# EasyEDA Pro project ProPrj_步进电机驱动功能板_2026-11-11.epro

# Schematic Schematic1
Assembly Variant: Basic; Board Name: Board1; Create Date: 2026-11-10; Page Name: P1; Project Name: 步进电机驱动功能板; Schematic Name: Schematic1; Update Date: 2026-11-10; Company: 嘉立创EDA; Page Size: A4; Version: V1.0
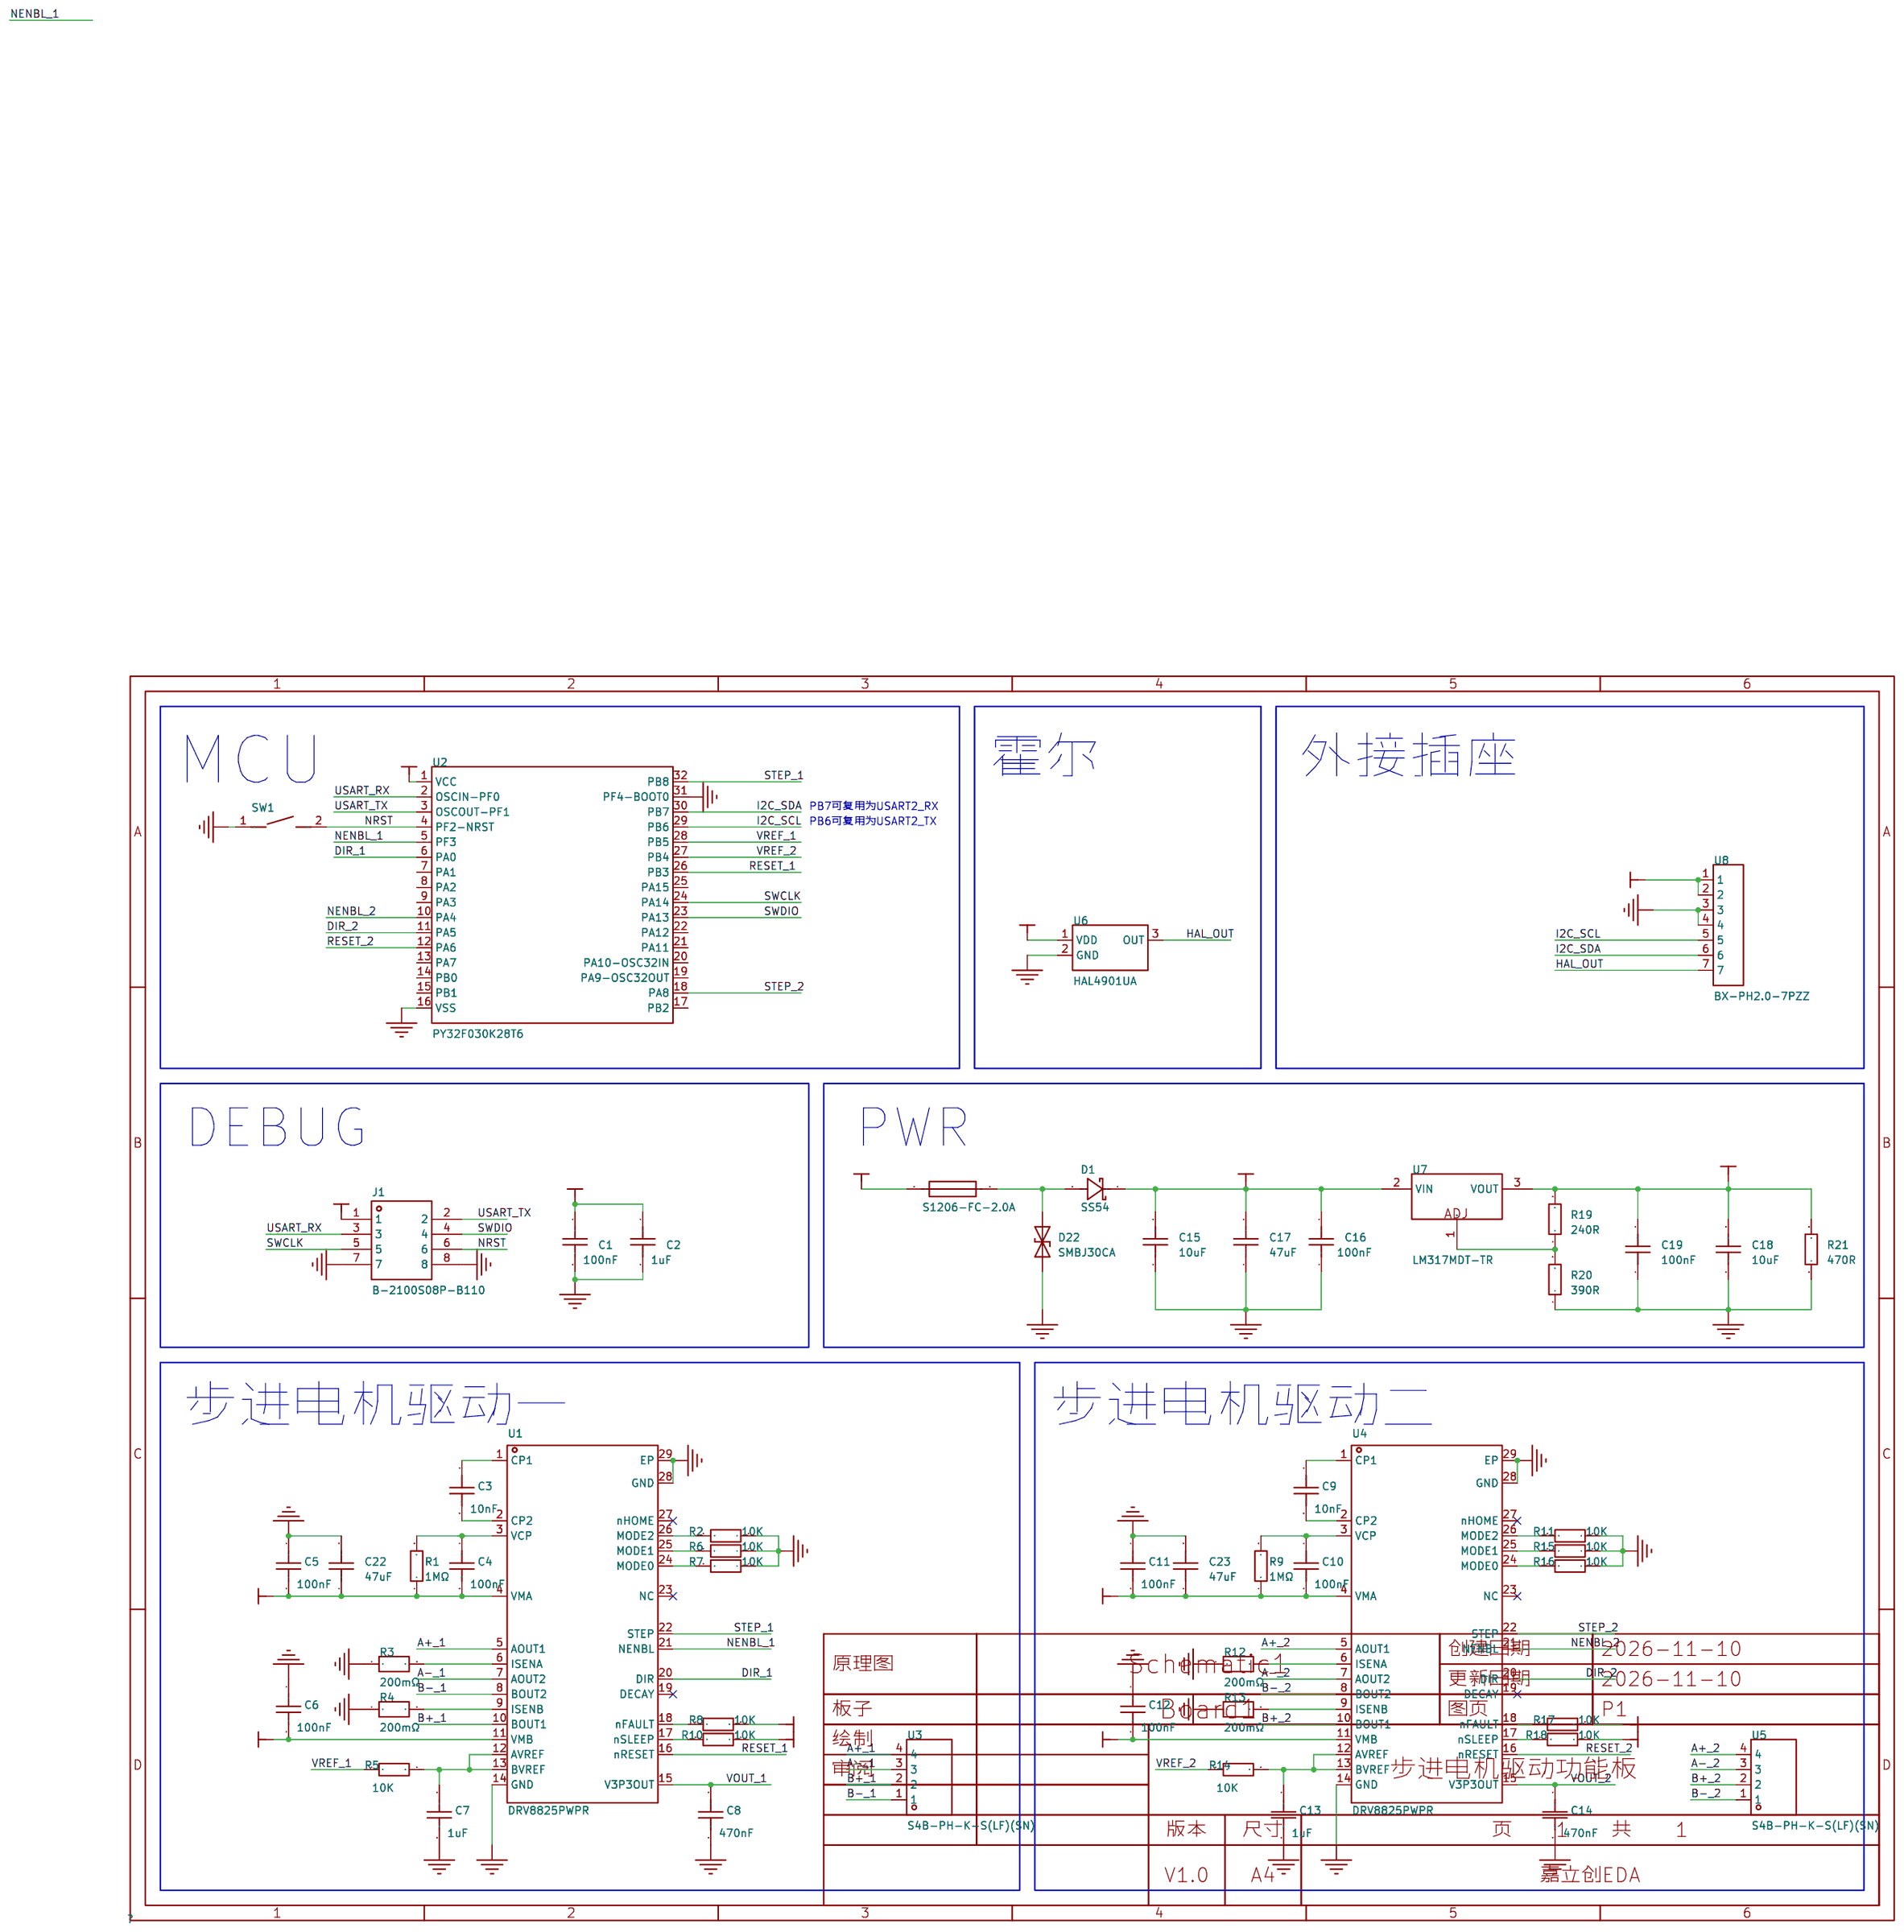
[diagram p0: schematic sheet]

## Parts
C1  100nF  [C0603]
C2  1uF  [C0603]
C3  10nF  [C0603]
C4  100nF  [C0603]
C5  100nF  [C0603]
C6  100nF  [C0603]
C7  1uF  [C0603]
C8  470nF  [C0603]
C9  10nF  [C0603]
C10  100nF  [C0603]
C11  100nF  [C0603]
C12  100nF  [C0603]
C13  1uF  [C0603]
C14  470nF  [C0603]
C15  10uF  [C0805]
C16  100nF  [C0603]
C17  47uF  [C0805]
C18  10uF  [C0805]
C19  100nF  [C0603]
C22  47uF  [C0805]
C23  47uF  [C0805]
D1  SS54  [SMA_L4.3-W2.6-LS5.0-RD]
D22  SMBJ30CA  [SMB_L4.3-W3.6-LS5.4-BI]
F2  S1206-FC-2.0A  [F1206]
J1  B-2100S08P-B110  [HDR-TH_8P-P2.54-V-M-R2-C4-S2.54]
R1  1MΩ  [R0603]
R2  10K  [R0603]
R3  200mΩ  [R2512]
R4  200mΩ  [R2512]
R5  10K  [R0603]
R6  10K  [R0603]
R7  10K  [R0603]
R8  10K  [R0603]
R9  1MΩ  [R0603]
R10  10K  [R0603]
R11  10K  [R0603]
R12  200mΩ  [R2512]
R13  200mΩ  [R2512]
R14  10K  [R0603]
R15  10K  [R0603]
R16  10K  [R0603]
R17  10K  [R0603]
R18  10K  [R0603]
R19  240R  [R0603]
R20  390R  [R0603]
R21  470R  [R0603]
SW1  TS-1088-AR02016  [SW-SMD_L3.9-W3.0-P4.45]
U1  DRV8825PWPR  [HTSSOP-28_L9.7-W4.4-P0.65-LS6.4-BL-EP]
U2  PY32F030K28T6  [LQFP-32_L7.0-W7.0-P0.80-LS9.0-BL]
U3  S4B-PH-K-S(LF)(SN)  [CONN-TH_4P-P2.00_S4B-PH-K-S-LF-SN]
U4  DRV8825PWPR  [HTSSOP-28_L9.7-W4.4-P0.65-LS6.4-BL-EP]
U5  S4B-PH-K-S(LF)(SN)  [CONN-TH_4P-P2.00_S4B-PH-K-S-LF-SN]
U6  HAL4901UA  [HDR-TH_3P-P2.54-V-M]
U7  LM317MDT-TR  [TO-252-2_L6.6-W6.1-P4.57-LS9.9-TL]
U8  BX-PH2.0-7PZZ  [CONN-TH_7P-P2.00_BX-PH2.0-7PZZ]

## Library data of the parts
C1 C2 = CC0603KRX7R9BB104: 容值:100nF;精度:±10%;额定电压:50V;温度系数:X7R;; LCSC Part Name: 100nF ±10% 50V; Supplier Part: C14663; Manufacturer: YAGEO(国巨); Supplier Footprint: 0603; JLCPCB Part Class: Basic Part; Datasheet: https://item.szlcsc.com/datasheet/CC0603KRX7R9BB104/15331.html; Supplier: LCSC; Tolerance: ±10%; Voltage Rating: 50V; Temperature Coefficient: X7R
C3-C14 C16 C19 = CAP_0603: Supplier Footprint: 0603
C15 C17 C18 = CAP_0805: Supplier Footprint: 0805
C22 C23 = HGC0805R5476M100NSLJ: 容值:47uF;精度:±20%;额定电压:10V;温度系数:X5R;; LCSC Part Name: 47uF ±20% 10V; Supplier Part: C19103846; Manufacturer: Chinocera(华瓷); Supplier Footprint: 0805; JLCPCB Part Class: Extended Part; Datasheet: https://item.szlcsc.com/datasheet/HGC0805R5476M100NSLJ/20314358.html; Supplier: LCSC; Tolerance: ±20%; Voltage Rating: 10V; Temperature Coefficient: X5R
D1 = SS56_C18199169: 二极管配置:独立式;正向压降(Vf):700mV@5A;直流反向耐压(Vr):60V;整流电流:5A;; LCSC Part Name: 电压:60V 电流:5A; Supplier Part: C18199169; Manufacturer: R+O(宏嘉诚); Supplier Footprint: SMA(DO-214AC); JLCPCB Part Class: Extended Part; Datasheet: https://item.szlcsc.com/datasheet/SS56/19354401.html; Supplier: LCSC; Diode Configuration: 独立式; Voltage - Forward(Vf@If): 700mV@5A; Voltage - DC Reverse(Vr): 60V; Current - Rectified: 5A; Reverse Leakage Current (Ir): 200uA@60V; Operating Junction Temperature Range: -55℃~+125℃; Non-Repetitive Peak Forward Surge Current: 120A
D22 = SMBJ30CA_C83847: 极性:双向;反向截止电压(Vrwm):30V;钳位电压:48.4V;峰值脉冲电流(Ipp):12.4A;峰值脉冲功率(Ppp):600W@10/1000us;击穿电压(VBR):33.3V;; LCSC Part Name: 双向TVS 30V截止 峰值浪涌电流：12.4A; Supplier Part: C83847; Manufacturer: Littelfuse(美国力特); Supplier Footprint: DO-214AA; JLCPCB Part Class: Extended Part; Datasheet: https://item.szlcsc.com/datasheet/SMBJ30CA/85014.html; Supplier: LCSC; Polarity: 双向; Reverse Stand-Off Voltage (Vrwm): 30V; Clamping Voltage: 48.4V; Peak Pulse Current (Ipp): 12.4A; Peak Pulse Power Dissipation (Ppp): 600W@10/1000us; Voltage - Breakdown: 33.3V; Reverse Leakage Current (Ir): 1uA; Number of Channels: 单路; Operating Temperature: -65℃~+150℃; level of protection: IEC 61000-4-4；IEC 61000-4-2; Type: TVS
F2 = S1206-FC-2.0A: 类型:贴片式保险丝;额定电流:2A;额定电压:100V;分断能力:50A@100VDC;; LCSC Part Name: 保险丝 2A 100V; Supplier Part: C2691995; Manufacturer: SART(萨特); Supplier Footprint: 1206; JLCPCB Part Class: Extended Part; Datasheet: https://item.szlcsc.com/datasheet/S1206-FC-2.0A/2802628.html; Supplier: LCSC; Type: 贴片式保险丝; Current Rating: 2A; Voltage Rating (DC): 100V; Operating Temperature: -55℃~+125℃; Melting I2t: 0.1; Interrupt Rating: 50A@100VDC; Length: 3.2mm; Width: 1.6mm; Height: 0.8mm
J1 = B-2100S08P-B110: 插针结构:2x4P;间距:2.54mm;行距:2.54mm;圆针/方针:方针;安装方式:直插;排数:双排;总PIN位数:8P;额定电流:3A;额定电压:-;配合针长度:6mm;塑高:2.54mm;端接针长度:3mm;触头材质:黄铜;触头镀层:金;工作温度:-40℃~+105℃;颜色:黑色;; LCSC Part Name: 2x4P 间距:2.54mm 方针 直插; Supplier Part: C124386; Manufacturer: Ckmtw(灿科盟); Supplier Footprint: 插件,P=2.54mm; JLCPCB Part Class: Extended Part; Datasheet: https://item.szlcsc.com/datasheet/B-2100S08P-B110/125661.html; Supplier: LCSC; Pin Structure: 2x4P; Pitch: 2.54mm; Row Spacing: 2.54mm; Circluar Pins/Square Pins: 方针; Mounting Type: 直插; Number of Rows: 双排; Number of Pins: 8P; Current Rating: 3A; Length of Mating Pin: 6mm; Insulation Height: 2.54mm; Length of End Connection Pin: 3mm; Contact Material: 黄铜; Contact Plating: 金; Operating Temperature: -40℃~+105℃; Color: 黑色
R1 R2 R5-R11 R14-R21 = Res_0603: Supplier Footprint: 0603
R3 R4 R12 R13 = FRM252WJR200TK: 电阻类型:采样电阻;阻值:200mΩ;精度:±5%;功率:2W;温度系数:±50ppm/℃;; LCSC Part Name: 200mΩ ±5% 2W 合金电阻; Supplier Part: C7420022; Manufacturer: FOJAN(富捷); Supplier Footprint: 2512; JLCPCB Part Class: Extended Part; Datasheet: https://item.szlcsc.com/datasheet/FRM252WJR200TK/8395315.html; Supplier: LCSC; Type: 采样电阻; Tolerance: ±5%; Power(Watts): 2W; Temperature Coefficient: ±50ppm/℃
SW1 = TS-1088-AR02016: 电路结构:单刀单掷;按钮形状:圆形按钮;作用力:1.6N;安装方式:立贴;开关长度:3.9mm;开关宽度:3mm;开关高度:2mm;带支架:不带支架;触点电流:50mA;额定电压:12V;带灯:-;工作寿命:10万次;; LCSC Part Name: 3.9*3*2mm 立贴 轻触开关; Supplier Part: C720477; Manufacturer: XUNPU(讯普); Supplier Footprint: SMD,4x3mm; JLCPCB Part Class: Basic Part; Datasheet: https://item.szlcsc.com/datasheet/TS-1088-AR02016/763484.html; Supplier: LCSC; Circuit: 单刀单掷; Actuator Style: 圆形按钮; Operating Force: 1.6N; Mounting Type: 立贴; Length: 3.9mm; Width: 3mm; Switch Height: 2mm; with Bracket: 不带支架; Contact Current: 50mA; Voltage Rating: 12V; Actuator/Cap Color: 黑色; Termination Style: SMD接片; Life: 10万次; Operating Temperature: -30℃~+80℃; Check: true
U1 U4 = DRV8825PWPR: DRV8825 具有电流调节功能和 1/32 微步进的 45V、2.5A 双极步进电机驱动器; LCSC Part Name: 2.5A 45V电机驱动芯片; Supplier Part: C81582; Manufacturer: TI(德州仪器); Supplier Footprint: HTSSOP-28-EP; JLCPCB Part Class: Extended Part; Datasheet: https://www.ti.com/cn/lit/ds/symlink/drv8825.pdf; Supplier: LCSC; Motor Drive Voltage(Vm): 8.2V~45V; Output Current: 2.5A; Number of H-bridges: 2; Drive Type: 双极驱动; Step Resolution: 32; Interface: STEP/DIR; Technology: 是; RDS(on): 200mΩ; Operating Temperature: -40℃~+85℃; Features: 过流保护；防止电机失步功能；过温保护；欠压锁定
U2 = PY32F030K28T6: 应用领域:-;; LCSC Part Name: PY32F030K28T6 30IO; Supplier Part: C3018720; Manufacturer: PUYA(普冉); Supplier Footprint: LQFP-32(7x7); JLCPCB Part Class: Extended Part; Datasheet: https://item.szlcsc.com/datasheet/PY32F030K28T6/3531934.html; Supplier: LCSC; Program Storage Size: 64KB; Program Memory Type: FLASH; Check: true
U3 U5 = S4B-PH-K-S(LF)(SN): 插针结构:1x4P;间距:2mm;安装方式:弯插;参考系列:PH;总PIN数:4P;排数:1;每排PIN数:4;行距:-;额定电流:2A;触头材质:黄铜;触头镀层:锡;工作温度:-25℃~+85℃;; LCSC Part Name: 1x4P 间距:2mm 弯插 系列:PH; Supplier Part: C157926; Manufacturer: JST; Supplier Footprint: 弯插,P=2mm; JLCPCB Part Class: Extended Part; Datasheet: https://item.szlcsc.com/datasheet/S4B-PH-K-S(LF)(SN)/169274.html; Supplier: LCSC; Pins Structure: 1x4P; Pitch: 2mm; Mounting Type: 弯插; Reference Series: PH; Number of Pins: 4P; Number of Rows: 1; Number of PINs Per Row: 4; Current Rating: 2A; Contact Material: 黄铜; Contact Plating: 锡; Operating Temperature: -25℃~+85℃; Voltage Rating: 100V; Plastic Material: PA66; Flame Retardant Rating: UL94V-0; Supplementary Features: 打K脚; Color: 白色; Z-Height of the Board: 4.8mm; X-Length of Bottom Edge on Board (Spacing Line): 9.9mm; Y-Width of Bottom Edge on Board: 7.6mm
U6 = HAL4901UA: 超高灵敏度线性霍尔元件，智能围棋霍尔IC; LCSC Part Name: 超高灵敏度线性霍尔元件,智能围棋霍尔IC; Supplier Part: C7420987; Manufacturer: Hallwee(霍尔微电子); Supplier Footprint: TO-92S; JLCPCB Part Class: Extended Part; Datasheet: https://item.szlcsc.com/datasheet/HAL4901UA/8400266.html; Supplier: LCSC; Magnetic Field Range: ±10mT; Sensitivity: 15mV/Gs; Sensitivity Temperature Bleaching: ±10%/℃; Linearity: ±1.5%; Voltage - Supply: 2.5V~6.5V; Supply Current: 1.9mA; Operating Temperature: -40℃~+150℃
U7 = LM317MDT-TR: 输出极性:正极;工作电压:40V;输出电压:1.2V~37V;输出电流:500mA;电源纹波抑制比(PSRR):80dB@(120Hz);输出类型:可调;; LCSC Part Name: 1.2V~37V 500mA 40V; Supplier Part: C68136; Manufacturer: ST(意法半导体); Supplier Footprint: TO-252-2(DPAK); JLCPCB Part Class: Extended Part; Datasheet: https://item.szlcsc.com/datasheet/LM317MDT-TR/69238.html; Supplier: LCSC; Output Configuration: 正极; Voltage - Supply: 40V; Output Voltage: 1.2V~37V; Output Current: 500mA; Power Supply Rejection Ratio (PSRR): 80dB@(120Hz); Noise: 0.003%Vout; Features: 短路保护；热关断; Operating Temperature: 0℃~+125℃@(Tj); Output Type: 可调; Number of Outputs: 1
U8 = BX-PH2.0-7PZZ: 插针结构:1x7P;间距:2mm;安装方式:直插;参考系列:PH;总PIN数:7P;排数:1;每排PIN数:7;行距:-;额定电流:2A;触头材质:黄铜;触头镀层:锡;工作温度:-25℃~+85℃;; LCSC Part Name: 1x7P 间距:2mm 直插 系列:PH; Supplier Part: C18077749; Manufacturer: Bossie(博锡); Supplier Footprint: 插件,P=2mm; JLCPCB Part Class: Extended Part; Datasheet: https://item.szlcsc.com/datasheet/BX-PH2.0-7PZZ/19218150.html; Supplier: LCSC; Pins Structure: 1x7P; Pitch: 2mm; Mounting Type: 直插; Reference Series: PH; Number of Pins: 7P; Number of Rows: 1; Number of PINs Per Row: 7; Current Rating: 2A; Contact Material: 黄铜; Contact Plating: 锡; Operating Temperature: -25℃~+85℃; Voltage Rating: 250V; Plastic Material: PA66; Flame Retardant Rating: UL94V-0; Color: 白色; Z-Height of the Board: 6.05mm; X-Length of Bottom Edge on Board (Spacing Line): 16mm; Y-Width of Bottom Edge on Board: 4.7mm

## Nets
3V3: C1.1 C2.1 C18.2 C19.2 J1.1 R8.2 R10.1 R17.2 R18.1 R19.2 R21.2 U2.1(VCC) U6.1(VDD) U7.3(VOUT)
+24V: C4.2 C5.2 C6.2 C10.2 C11.2 C12.2 C15.2 C16.2 C17.2 C22.1 C23.1 D1.1(K) R1.1 R9.1 U1.4(VMA) U1.11(VMB) U4.4(VMA) U4.11(VMB) U7.2(VIN)
GND: C1.2 C2.2 C5.1 C6.1 C7.2 C8.2 C11.1 C12.1 C13.2 C14.2 C15.1 C16.1 C17.1 C18.1 C19.1 C22.2 C23.2 D22.2(A1) J1.7 J1.8 R2.1 R3.1 R4.1 R6.1 R7.1 R11.1 R12.1 R13.1 R15.1 R16.1 R20.1 R21.1 SW1.1 U1.14(GND) U1.28(GND) U1.29(EP) U2.16(VSS) U2.31(PF4-BOOT0) U4.14(GND) U4.28(GND) U4.29(EP) U6.2(GND) U8.3 U8.4
A+_1: U1.5(AOUT1) U3.4
A+_2: U4.5(AOUT1) U5.4
A-_1: U1.7(AOUT2) U3.3
A-_2: U4.7(AOUT2) U5.3
B+_1: U1.10(BOUT1) U3.2
B+_2: U4.10(BOUT1) U5.2
B-_1: U1.8(BOUT2) U3.1
B-_2: U4.8(BOUT2) U5.1
DIR_1: U1.20(DIR) U2.6(PA0)
DIR_2: U2.11(PA5) U4.20(DIR)
HAL_OUT: U6.3(OUT) U8.7
I2C_SCL: U2.29(PB6) U8.5
I2C_SDA: U2.30(PB7) U8.6
NENBL_1: U1.21(NENBL) U2.5(PF3)
NENBL_2: U2.10(PA4) U4.21(NENBL)
NRST: J1.6 SW1.2 U2.4(PF2-NRST)
RESET_1: U1.16(nRESET) U2.26(PB3)
RESET_2: U2.12(PA6) U4.16(nRESET)
STEP_1: U1.22(STEP) U2.32(PB8)
STEP_2: U2.18(PA8) U4.22(STEP)
SWCLK: J1.5 U2.24(PA14)
SWDIO: J1.4 U2.23(PA13)
USART_RX: J1.3 U2.2(OSCIN-PF0)
USART_TX: J1.2 U2.3(OSCOUT-PF1)
VCOM: F2.1 U8.1 U8.2
VOUT_1: C8.1 U1.15(V3P3OUT)
VOUT_2: C14.1 U4.15(V3P3OUT)
VREF_1: R5.1 U2.28(PB5)
VREF_2: R14.1 U2.27(PB4)
$1N37: C3.1 U1.1(CP1)
$1N38: C3.2 U1.2(CP2)
$1N39: C4.1 R1.2 U1.3(VCP)
$1N53: R4.2 U1.9(ISENB)
$1N56: R3.2 U1.6(ISENA)
$1N57: C7.1 R5.2 U1.12(AVREF) U1.13(BVREF)
$1N72: R10.2 U1.17(nSLEEP)
$1N80: R8.1 U1.18(nFAULT)
$1N83: R2.2 U1.26(MODE2)
$1N84: R6.2 U1.25(MODE1)
$1N85: R7.2 U1.24(MODE0)
$1N96: R11.2 U4.26(MODE2)
$1N97: R15.2 U4.25(MODE1)
$1N98: R16.2 U4.24(MODE0)
$1N100: R17.1 U4.18(nFAULT)
$1N107: C13.1 R14.2 U4.12(AVREF) U4.13(BVREF)
$1N108: R12.2 U4.6(ISENA)
$1N109: R13.2 U4.9(ISENB)
$1N112: R18.2 U4.17(nSLEEP)
$1N121: C10.1 R9.2 U4.3(VCP)
$1N122: C9.2 U4.2(CP2)
$1N123: C9.1 U4.1(CP1)
$1N134: D1.2(A) D22.1(A2) F2.2
$1N139: R19.1 R20.2 U7.1(ADJ)

Not connected (* = marked no-connect by the designer): U1 19(DECAY)* 23(NC)* 27(nHOME)*; U2 7(PA1) 8(PA2) 9(PA3) 13(PA7) 14(PB0) 15(PB1) 17(PB2) 19(PA9-OSC32OUT) 20(PA10-OSC32IN) 21(PA11) 22(PA12) 25(PA15); U4 19(DECAY)* 23(NC)* 27(nHOME)*

## Notes on the sheet
- MCU
- 霍尔
- 外接插座
- PB7可复用为USART2_RX
- PB6可复用为USART2_TX
- DEBUG
- PWR
- 步进电机驱动一
- 步进电机驱动二

# Board PCB1
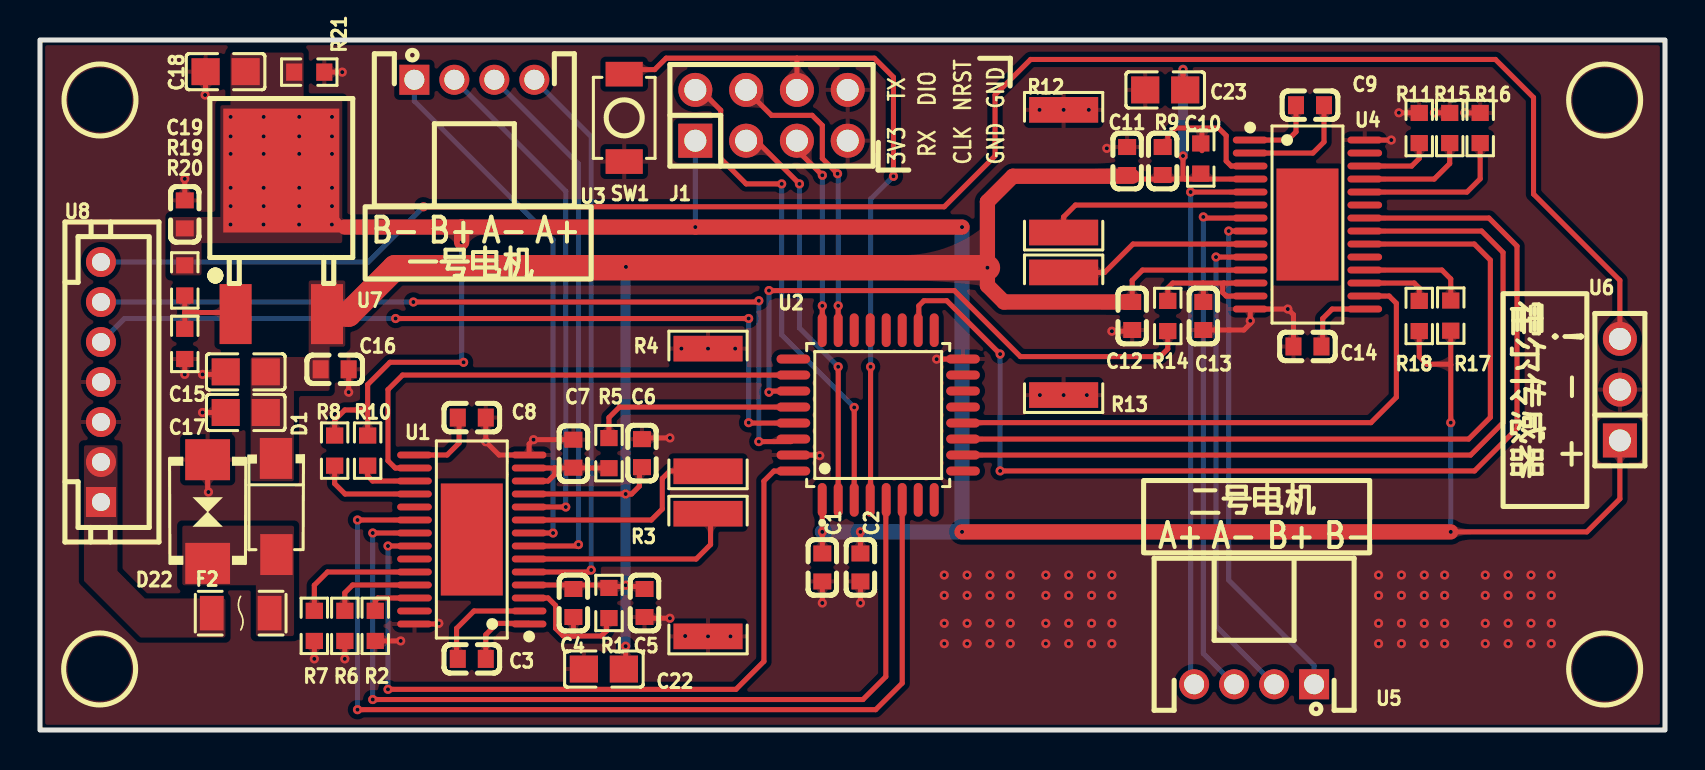
[diagram p1: board, top side]
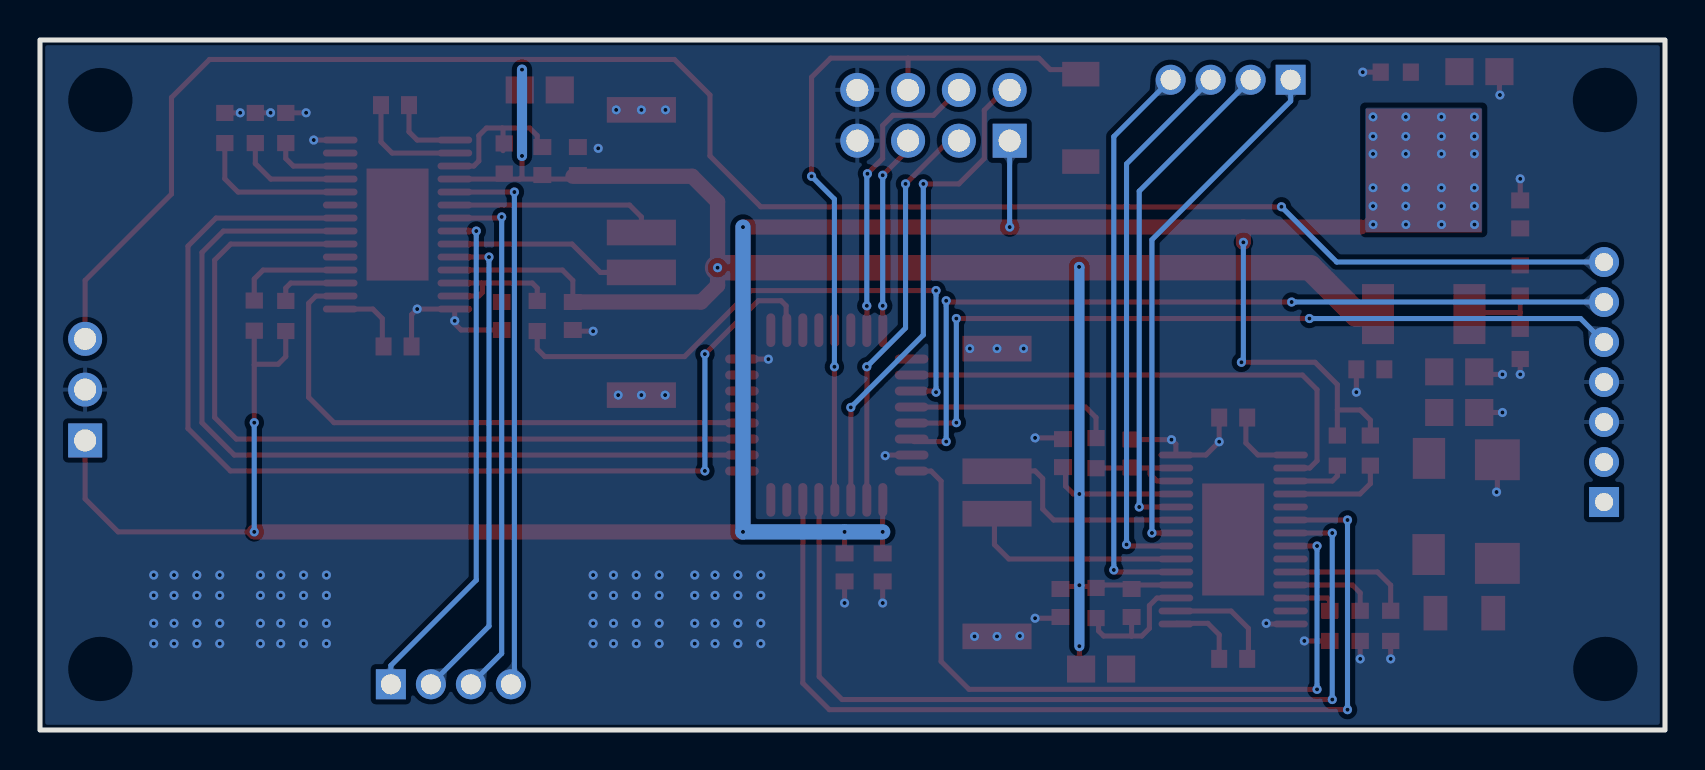
[diagram p2: board, bottom side, seen from below]

Outline 81.25 x 34.5 mm; copper layers: Top Layer, Bottom Layer. Coordinates in mm from the lower left corner of the outline.
Outline path: rectangle 0,34.5 81.25,0
Stack: Top Layer 0.035mm / Dielectric1 1.51mm FR4 er 4.5 / Bottom Layer 0.035mm

## Design rules (mm)
spacing copperThickness1oz (default): track to track 0.102, other pairs 0.102 to 0.3
spacing copperThickness2oz: track to track 0.203, other pairs 0.152 to 0.3
track width copperThickness1oz (default): min 0.127, default 0.254, max 2.54
track width copperThickness2oz: min 0.203, default 0.254, max 2.54
differential pair differentialPair (default): width min 0.127, default 0.254, max 2.54; gap min 0.152, default 0.152
net GND uses copperRegion
net +24V uses copperRegion
net 3V3 uses copperRegion
net $1N134 uses PWR_copperThickness1oz
net VCOM uses copperRegion
pour e3841 uses PWR_default, default
pour e3845 uses PWR_copperThickness1oz

## Placement (name value [footprint] x y rotation side)
C1  100nF  [C0603]  39.12 8.13 270 top
C2  1uF  [C0603]  41.02 8.13 270 top
C3  10nF  [C0603]  21.59 3.56 180 top
C4  100nF  [C0603]  26.67 6.35 90 top
C5  100nF  [C0603]  30.23 6.35 90 top
C6  100nF  [C0603]  30.1 13.84 270 top
C7  1uF  [C0603]  26.67 13.82 90 top
C8  470nF  [C0603]  21.59 15.62 0 top
C9  10nF  [C0603]  63.5 31.24 0 top
C10  100nF  [C0603]  56.13 28.45 270 top
C11  100nF  [C0603]  54.36 28.45 270 top
C12  100nF  [C0603]  54.61 20.7 90 top
C13  1uF  [C0603]  58.17 20.7 270 top
C14  470nF  [C0603]  63.37 19.18 180 top
C15  10uF  [C0805]  10.29 17.91 0 top
C16  100nF  [C0603]  14.73 18.03 180 top
C17  47uF  [C0805]  10.29 15.88 0 top
C18  10uF  [C0805]  9.28 32.92 0 top
C19  100nF  [C0603]  7.24 25.78 270 top
C22  47uF  [C0805]  28.19 3.05 180 top
C23  47uF  [C0805]  56.26 32 180 top
D1  SS54  [SMA_L4.3-W2.6-LS5.0-RD]  11.81 11.18 270 top
D22  SMBJ30CA  [SMB_L4.3-W3.6-LS5.4-BI]  8.38 10.92 90 top
F2  S1206-FC-2.0A  [F1206]  10.03 5.84 0 top
J1  B-2100S08P-B110  [HDR-TH_8P-P2.54-V-M-R2-C4-S2.54]  36.58 30.73 0 top
R1  1MΩ  [R0603]  28.45 6.35 270 top
R2  10K  [R0603]  16.76 5.21 90 top
R3  200mΩ  [R2512]  33.4 7.75 90 top
R4  200mΩ  [R2512]  33.4 16 270 top
R5  10K  [R0603]  28.45 13.84 270 top
R6  10K  [R0603]  15.24 5.21 90 top
R7  10K  [R0603]  13.72 5.21 90 top
R8  10K  [R0603]  14.73 13.97 90 top
R9  1MΩ  [R0603]  58.04 28.58 90 top
R10  10K  [R0603]  16.38 13.97 270 top
R11  10K  [R0603]  68.96 30.1 270 top
R12  200mΩ  [R2512]  51.18 27.94 270 top
R13  200mΩ  [R2512]  51.18 19.81 90 top
R14  10K  [R0603]  56.39 20.7 90 top
R15  10K  [R0603]  70.49 30.1 270 top
R16  10K  [R0603]  72.01 30.1 270 top
R17  10K  [R0603]  70.54 20.72 270 top
R18  10K  [R0603]  68.96 20.7 90 top
R19  240R  [R0603]  7.24 22.48 90 top
R20  390R  [R0603]  7.24 19.3 90 top
R21  470R  [R0603]  13.46 32.89 180 top
SW1  TS-1088-AR02016  [SW-SMD_L3.9-W3.0-P4.45]  29.21 30.61 90 top
U1  DRV8825PWPR  [HTSSOP-28_L9.7-W4.4-P0.65-LS6.4-BL-EP]  21.59 9.53 90 top
U2  PY32F030K28T6  [LQFP-32_L7.0-W7.0-P0.80-LS9.0-BL]  41.91 15.75 0 top
U3  S4B-PH-K-S(LF)(SN)  [CONN-TH_4P-P2.00_S4B-PH-K-S-LF-SN]  21.72 32.51 0 top
U4  DRV8825PWPR  [HTSSOP-28_L9.7-W4.4-P0.65-LS6.4-BL-EP]  63.37 25.27 270 top
U5  S4B-PH-K-S(LF)(SN)  [CONN-TH_4P-P2.00_S4B-PH-K-S-LF-SN]  60.71 2.29 180 top
U6  HAL4901UA  [HDR-TH_3P-P2.54-V-M]  78.99 17.02 90 top
U7  LM317MDT-TR  [TO-252-2_L6.6-W6.1-P4.57-LS9.9-TL]  12.06 24.38 90 top
U8  BX-PH2.0-7PZZ  [CONN-TH_7P-P2.00_BX-PH2.0-7PZZ]  3.05 17.4 90 top

## Footprints (pads in the part's own frame, mm; a bottom-side part is the same pattern mirrored in y, then rotated)
C0603
  rect 0.8x0.9 smd: 1(-0.7,0) 2(0.7,0)
C0805
  rect 1.41x1.35 smd: 1(-1,0) 2(1,0)
CONN-TH_4P-P2.00_S4B-PH-K-S-LF-SN
  rect 1.5x1.5 hole 1: 1(-3,0)
  round 1.5 hole 1: 2(-1,0) 3(1,0) 4(3,0)
CONN-TH_7P-P2.00_BX-PH2.0-7PZZ
  rect 1.5x1.5 hole 0.9: 1(-6,0)
  round 1.5 hole 0.9: 2(-4,0) 3(-2,0) 4(0,0) 5(2,0) 6(4,0) 7(6,0)
F1206
  rect 1.19x1.728 smd: 1(-1.445,0) 2(1.445,0)
HDR-TH_3P-P2.54-V-M
  rect 1.7x1.7 hole 1.1: 1(-2.54,0)
  round 1.7 hole 1.1: 2(0,0) 3(2.54,0)
HDR-TH_8P-P2.54-V-M-R2-C4-S2.54
  rect 1.7x1.7 hole 1.1: 1(-3.81,-1.27)
  round 1.7 hole 1.1: 2(-3.81,1.27) 3(-1.27,-1.27) 4(-1.27,1.27) 5(1.27,-1.27) 6(1.27,1.27) 7(3.81,-1.27) 8(3.81,1.27)
HTSSOP-28_L9.7-W4.4-P0.65-LS6.4-BL-EP
  oval 0.343x1.732 smd: 1(-4.225,-2.866) 2(-3.575,-2.866) 3(-2.925,-2.866) 4(-2.275,-2.866) 5(-1.625,-2.866) 6(-0.975,-2.866) 7(-0.325,-2.866) 8(0.325,-2.866) 9(0.975,-2.866) 10(1.625,-2.866) 11(2.275,-2.866) 12(2.925,-2.866) 13(3.575,-2.866) 14(4.225,-2.866) 15(4.225,2.866) 16(3.575,2.866) 17(2.925,2.866) 18(2.275,2.866) 19(1.625,2.866) 20(0.975,2.866) 21(0.325,2.866) 22(-0.325,2.866) 23(-0.975,2.866) 24(-1.625,2.866) 25(-2.275,2.866) 26(-2.925,2.866) 27(-3.575,2.866) 28(-4.225,2.866)
  rect 5.6x3.1 smd: 29(0,0)
LQFP-32_L7.0-W7.0-P0.80-LS9.0-BL
  oval 0.448x1.684 smd: 1(-2.8,-4.242) 2(-2,-4.242) 3(-1.2,-4.242) 4(-0.4,-4.242) 5(0.4,-4.242) 6(1.2,-4.242) 7(2,-4.242) 8(2.8,-4.242) 17(2.8,4.242) 18(2,4.242) 19(1.2,4.242) 20(0.4,4.242) 21(-0.4,4.242) 22(-1.2,4.242) 23(-2,4.242) 24(-2.8,4.242)
  oval 1.684x0.448 smd: 9(4.242,-2.8) 10(4.242,-2) 11(4.242,-1.2) 12(4.242,-0.4) 13(4.242,0.4) 14(4.242,1.2) 15(4.242,2) 16(4.242,2.8) 25(-4.242,2.8) 26(-4.242,2) 27(-4.242,1.2) 28(-4.242,0.4) 29(-4.242,-0.4) 30(-4.242,-1.2) 31(-4.242,-2) 32(-4.242,-2.8)
R0603
  rect 0.806x0.864 smd: 1(-0.753,0) 2(0.753,0)
R2512
  rect 1.282x3.456 smd: 1(-3.067,0) 2(3.067,0)
SMA_L4.3-W2.6-LS5.0-RD
  rect 2.046x1.62 smd: 1(-2.404,-0.009) 2(2.404,0.009)
SMB_L4.3-W3.6-LS5.4-BI
  rect 2.047x2.241 smd: 1(-2.591,0) 2(2.591,0)
SW-SMD_L3.9-W3.0-P4.45
  rect 1.23x1.86 smd: 1(-2.185,0) 2(2.185,0)
TO-252-2_L6.6-W6.1-P4.57-LS9.9-TL
  rect 3x1.6 smd: 1(-3.587,2.285) 2(-3.589,-2.285)
  rect 6.2x5.8 smd: 3(3.588,0)

## Nets
As in the schematic.

Pads without a net: U1 19 23 27; U2 7 8 9 13 14 15 17 19 20 21 22 25; U4 19 23 27

## Via types
v1: diameter 0.457, hole 0.203, Top Layer to Bottom Layer, 179 vias

## Routing (per net, layer and track width the routed paths; a pad name or vN(x,y) marks a point on that pad's centre or on a via; arc(x,y) is an arc through that point)
3V3: length 132.4
  Top Layer w0.254: 16.38,16 15.24,16 14.73,15.49 R8.2 ; 16.38,16 16.38,17.27 17.5,18.39 v1(21.18,18.39) ; 16.38,16 R10.1 ; U6.1 78.99,11.56 77.34,9.91 v1(70.54,9.91) ; 70.54,18.26 70.51,18.29 69.34,18.29 68.96,18.67 R18.1 ; 70.54,18.26 v1(70.54,15.37) ; 70.54,18.26 R17.2 ; U2.1 39.12,11.5 v1(39.12,9.91) 39.12,8.95 39.24,8.83 ; U7.3 12.41,27.97 15.24,25.15 ; C2.1 v1(41.02,9.91)
  Top Layer w0.762: v1(70.54,9.91) v1(46.1,9.91) ; 15.24,25.15 21.08,25.15 ; 21.08,25.15 v1(21.08,24.38) ; 21.08,25.15 v1(32.77,25.15) v1(46.1,25.15)
  Bottom Layer w0.254: v1(70.54,15.37) v1(70.54,9.91) ; v1(32.77,25.15) 32.77,25.15 32.77,29.46 ; v1(21.18,18.39) 21.08,18.48 v1(21.08,24.38)
  Bottom Layer w0.762: v1(39.12,9.91) v1(41.02,9.91) v1(46.1,9.91) v1(46.1,25.15)
  vias: v1(9.53,30.66) v1(9.53,29.68) v1(9.53,28.81) v1(9.53,27.11) v1(9.53,26.19) v1(9.53,25.27) v1(11.18,30.66) v1(11.18,29.68) v1(11.18,28.81) v1(11.18,27.11) v1(11.18,26.19) v1(11.18,25.27) v1(12.96,30.66) v1(12.96,29.68) v1(12.96,28.81) v1(12.96,27.11) v1(12.96,26.19) v1(12.95,25.27) v1(14.6,30.66) v1(14.6,29.68) v1(14.6,28.81) v1(14.6,27.11) v1(14.6,26.19) v1(14.59,25.27)
+24V: length 105.6
  Top Layer w0.254: 57.27,27.55 60.51,27.55 ; 57.27,27.55 54.66,27.55 54.61,27.49 ; 57.27,27.55 57.15,27.66 v1(57.15,28.7) ; 60.51,23 55.13,23 54.61,22.48 C12.2 ; C23.1 57.15,32.11 v1(57.15,33.02) ; v1(29.28,4.19) 29.28,3.14 C22.1 ; 29.97,13.14 29.97,12.19 29.58,11.8 v1(29.28,11.8) U1.11 ; 28.32,7.1 28.39,7.18 29.97,7.18 ; U1.4 28.05,7.25 28.32,6.98
  Top Layer w0.762: 54.6,27.69 48.64,27.69 47.37,26.42 v1(47.37,23.11) 47.37,22.22 48.19,21.4 C12.2
  Top Layer w1.27: v1(47.37,23.11) 17.75,23.11 15.43,20.8 U7.2
  Bottom Layer w0.508: v1(29.3,23.16) 29.28,23.14 v1(29.28,11.8) v1(29.28,7.24) v1(29.28,4.19) ; v1(57.15,33.02) v1(57.15,28.7)
GND: length 39.4
  Top Layer w0.254: v1(31.5,5.59) 30.29,5.59 C5.1 ; C7.2 v1(24.68,14.52) 24.46,14.3 U1.14 22.95,13.75 v1(22.29,14.41) C8.2 ; C15.1 9.16,17.78 v1(8.13,17.78) ; C2.2 v1(41.02,6.35) ; v1(38.99,13.72) 38.96,13.75 U2.31 ; R7.1 v1(13.72,3.56) ; C1.2 v1(39.12,6.35) ; C17.1 v1(8.13,15.88) ; v1(67.94,30.86) 68.95,30.86 R11.1 ; C13.2 60.19,20 60.51,20.32 v1(60.51,20.46) 60.51,21.04 60.51,21.05 v1(62.39,21.05) 62.67,20.77 C14.2 ; v1(19.94,5.33) 19.91,5.3 U1.28 ; v1(8.42,11.9) 8.38,11.94 D22.2 ; U2.16 44.84,18.55 v1(44.83,18.54) ; R16.1 71.25,30.85 v1(71.24,30.86) ; v1(53.59,19.94) 54.55,19.94 C12.1 ; R15.1 70.48,30.86 v1(69.72,30.86) ; C6.1 30.16,14.61 v1(31.5,14.61) ; U4.28 v1(67.56,29.5) ; 7.24,26.48 v1(7.24,27.56) ; C18.1 8.28,31.77 v1(8.25,31.75) ; R21.1 v1(15.11,32.89) ; R20.1 v1(7.24,17.78) ; C16.1 v1(15.43,16.89) ; R6.1 v1(15.24,3.56) ; R2.1 v1(18.03,4.45)
  vias: v1(32.07,19.07) v1(32.26,4.7) v1(33.4,19.07) v1(33.4,4.68) v1(34.52,4.68) v1(34.76,19.07) v1(45.21,7.75) v1(45.21,6.73) v1(45.21,5.33) v1(45.21,4.32) v1(46.35,7.75) v1(46.35,6.73) v1(46.35,5.33) v1(46.35,4.32) v1(47.5,7.75) v1(47.5,6.73) v1(47.5,5.33) v1(47.5,4.32) v1(48.51,7.75) v1(48.51,6.73) v1(48.51,5.33) v1(48.51,4.32) v1(49.98,31.01) v1(49.99,16.75) v1(50.29,7.75) v1(50.29,6.73) v1(50.29,5.33) v1(50.29,4.32) v1(51.18,31.01) v1(51.18,16.75) v1(51.44,7.75) v1(51.44,6.73) v1(51.44,5.33) v1(51.44,4.32) v1(52.34,16.75) v1(52.44,31.01) v1(52.58,7.75) v1(52.58,6.73) v1(52.58,5.33) v1(52.58,4.32) v1(53.34,29.08) v1(53.59,7.75) v1(53.59,6.73) v1(53.59,5.33) v1(53.59,4.32) v1(66.93,7.75) v1(66.93,6.73) v1(66.93,5.33) v1(66.93,4.32) v1(68.07,7.75) v1(68.07,6.73) v1(68.07,5.33) v1(68.07,4.32) v1(69.22,7.75) v1(69.22,6.73) v1(69.22,5.33) v1(69.22,4.32) v1(70.23,7.75) v1(70.23,6.73) v1(70.23,5.33) v1(70.23,4.32) v1(72.26,7.75) v1(72.26,6.73) v1(72.26,5.33) v1(72.26,4.32) v1(73.41,7.75) v1(73.41,6.73) v1(73.41,5.33) v1(73.41,4.32) v1(74.55,7.75) v1(74.55,6.73) v1(74.55,5.33) v1(74.55,4.32) v1(75.56,7.75) v1(75.56,6.73) v1(75.56,5.33) v1(75.56,4.32)
A+_1: length 28.8
  Top Layer w0.254: v1(27.56,8) 27.46,7.9 U1.5
  Bottom Layer w0.254: v1(27.56,8) 27.56,29.67 U3.4
A+_2: length 27.7
  Top Layer w0.254: 60.51,26.9 v1(57.53,26.9)
  Bottom Layer w0.254: U5.4 57.53,2.46 v1(57.53,26.9)
A-_1: length 27.5
  Top Layer w0.254: v1(26.92,9.27) 26.85,9.2 U1.7
  Bottom Layer w0.254: v1(26.92,9.27) 26.92,28.31 U3.3
A-_2: length 26.4
  Top Layer w0.254: 60.51,25.6 58.22,25.6 v1(58.17,25.65)
  Bottom Layer w0.254: U5.3 58.17,3.83 v1(58.17,25.65)
B+_1: length 25.5
  Top Layer w0.254: U1.10 v1(26.29,11.15)
  Bottom Layer w0.254: U3.2 26.29,26.94 v1(26.29,11.15)
B+_2: length 24.3
  Top Layer w0.254: 60.51,23.65 v1(58.8,23.65)
  Bottom Layer w0.254: U5.2 58.8,5.19 v1(58.8,23.65)
B-_1: length 26.7
  Top Layer w0.254: U1.8 v1(25.65,9.85)
  Bottom Layer w0.254: U3.1 18.72,31.45 25.65,24.51 25.65,9.91
B-_2: length 25.5
  Top Layer w0.254: 60.51,24.95 v1(59.44,24.95)
  Bottom Layer w0.254: v1(59.44,24.95) 59.44,7.49 63.71,3.22 U5.1
DIR_1: length 49.3
  Top Layer w0.254: U1.20 v1(15.88,10.5) ; v1(15.88,1.02) 41.78,1.02 43.11,2.34 U2.6
  Bottom Layer w0.254: v1(15.88,10.5) v1(15.88,1.02)
DIR_2: length 41.3
  Top Layer w0.254: U4.20 71.71,24.3 72.52,23.5 72.52,15.63 71.44,14.55 U2.11
HAL_OUT: length 92.3
  Top Layer w0.254: U6.3 78.99,22.48 74.68,26.8 74.68,31.62 72.77,33.53 49.53,33.53 47.75,31.75 47.75,28.7 45.21,26.16 v1(19.18,26.16)
  Bottom Layer w0.254: U8.7 16.41,23.4 v1(19.18,26.16)
I2C_SCL: length 40.3
  Top Layer w0.254: v1(35.43,15.37) 35.45,15.35 U2.29 ; v1(35.43,20.57) v1(17.78,20.57)
  Bottom Layer w0.254: v1(35.43,15.37) v1(35.43,20.57) ; v1(17.78,20.57) 4.22,20.57 U8.5
I2C_SDA: length 41.7
  Top Layer w0.254: v1(35.94,14.42) 37.54,14.42 U2.30 ; v1(18.67,21.4) 35.88,21.4 v1(35.94,21.46)
  Bottom Layer w0.254: U8.6 v1(18.67,21.4) ; v1(35.94,14.42) v1(35.94,21.46)
NENBL_1: length 45.4
  Top Layer w0.254: U2.5 42.29,11.49 42.29,2.67 41.15,1.52 v1(16.64,1.52) ; U1.21 v1(16.64,9.85)
  Bottom Layer w0.254: v1(16.64,1.52) v1(16.64,9.85)
NENBL_2: length 43.5
  Top Layer w0.254: U2.10 71.53,13.75 73.15,15.37 73.15,23.88 72.08,24.95 U4.21
NRST: length 37.4
  Top Layer w0.254: U2.4 41.53,11.53 v1(41.53,18.16) ; 37.85,33.59 41.72,33.59 42.67,32.64 v1(42.67,27.69) ; 37.85,33.59 J1.6 ; 37.85,33.59 31.31,33.59 30.73,33.02 29.44,33.02 SW1.2
  Bottom Layer w0.254: v1(41.53,18.16) 41.53,26.54 v1(42.67,27.69)
RESET_1: length 25.6
  Top Layer w0.254: U1.16 17.76,13.1 17.4,13.46 17.4,17.02 18.13,17.75 U2.26
RESET_2: length 28.6
  Top Layer w0.254: U4.16 67.46,21.7 67.82,21.34 67.82,16.64 66.55,15.37 46.17,15.37 U2.12
STEP_1: length 38.6
  Top Layer w0.254: v1(17.4,2.03) 34.8,2.03 36.19,3.43 36.19,12.45 36.7,12.95 U2.32 ; U1.22 v1(17.4,9.2)
  Bottom Layer w0.254: v1(17.4,9.2) v1(17.4,2.03)
STEP_2: length 56.4
  Top Layer w0.254: U2.18 43.94,20.02 43.94,21.21 44.2,21.46 45.34,21.46 v1(48.01,18.8) ; v1(48.01,12.95) 71.73,12.95 73.85,15.08 73.85,24.19 72.45,25.6 U4.22
  Bottom Layer w0.254: v1(48.01,18.8) v1(48.01,12.95)
SWCLK: length 10
  Top Layer w0.254: v1(39.12,27.74) 37.85,29.01 J1.5 ; v1(39.12,21.21) 39.12,20 U2.24
  Bottom Layer w0.254: v1(39.12,21.21) v1(39.12,27.74)
SWDIO: length 15.1
  Top Layer w0.254: U2.23 v1(39.91,21.21) ; v1(39.88,27.81) 39.12,28.58 39.12,30.23 38.61,30.73 36.58,30.73 J1.4
  Bottom Layer w0.254: v1(39.88,27.81) 39.91,27.78 v1(39.91,21.21)
USART_RX: length 20.2
  Top Layer w0.254: v1(37.97,27.31) 35.81,29.46 J1.3 ; U2.2 v1(39.91,18.16)
  Bottom Layer w0.254: v1(37.97,27.31) 37.97,20.1 v1(39.91,18.16)
USART_TX: length 25
  Top Layer w0.254: J1.2 33.02,32 34.04,30.99 34.04,28.58 35.31,27.31 v1(37.08,27.31) ; U2.3 v1(40.71,16.13)
  Bottom Layer w0.254: v1(40.71,16.13) 37.08,19.75 v1(37.08,27.31)
VOUT_1: length 3.8
  Top Layer w0.254: C8.1 20.96,15.56 20.96,14.35 20.35,13.75 U1.15
VOUT_2: length 3.7
  Top Layer w0.254: C14.1 64.13,19.24 64.13,20.57 64.61,21.05 U4.15
VREF_1: length 10.5
  Top Layer w0.254: U2.28 28.97,16.15 28.45,15.62 28.45,14.72 28.32,14.6
VREF_2: length 28.7
  Top Layer w0.254: v1(36.45,21.97) 45.72,21.97 49.02,18.67 56.01,18.67 56.39,19.05 R14.1 ; v1(36.45,16.89) 36.51,16.95 U2.27
  Bottom Layer w0.254: v1(36.45,21.97) v1(36.45,16.89)
$1N37: length 3.6
  Top Layer w0.254: U1.1 24.42,5.33 22.86,5.33 22.29,4.76 C3.1
$1N38: length 5.5
  Top Layer w0.254: C3.2 20.83,3.62 20.83,5.08 21.7,5.95 U1.2
$1N39: length 7
  Top Layer w0.254: 26.67,4.7 28.07,4.7 28.32,4.95 28.32,5.6 ; 26.67,4.7 26.16,4.7 25.78,5.08 25.78,6.22 25.4,6.6 U1.3 ; 26.67,4.7 26.67,4.7 C4.1
$1N53: length 10.9
  Top Layer w0.254: R4.2 33.38,12.95 31.5,12.95 31.12,12.57 31.12,11.05 30.57,10.5 U1.9
$1N56: length 11
  Top Layer w0.254: U1.6 32.81,8.55 33.53,9.27 33.53,10.69 R3.2
$1N57: length 5.6
  Top Layer w0.254: U1.13 25.75,13.1 ; 25.75,13.1 28.31,13.1 28.32,13.09 ; 25.75,13.1 25.75,12.8 25.4,12.45 U1.12
$1N72: length 3.2
  Top Layer w0.254: U1.17 16.63,12.45 16.38,12.7 R10.2 16.64,13.22
$1N80: length 5.1
  Top Layer w0.254: U1.18 15.25,11.8 14.73,12.32 R8.1
$1N83: length 2.5
  Top Layer w0.254: U1.26 16.89,6.6 16.76,6.48 R2.2
$1N84: length 4.5
  Top Layer w0.254: R6.2 15.24,6.86 15.63,7.25 U1.25
$1N85: length 6.6
  Top Layer w0.254: R7.2 13.72,7.24 14.38,7.9 U1.24
$1N96: length 3.6
  Top Layer w0.254: U4.26 68.58,28.2 68.96,28.58 R11.2
$1N97: length 5.6
  Top Layer w0.254: R15.2 70.49,28.32 69.71,27.55 U4.25
$1N98: length 7.8
  Top Layer w0.254: R16.2 72.01,27.56 71.35,26.9 U4.24
$1N100: length 5.6
  Top Layer w0.254: U4.18 70.09,23 70.54,22.55 R17.1
$1N107: length 7.8
  Top Layer w0.254: 59.19,22.35 59.13,22.28 59.13,21.88 59.31,21.7 60.51,21.7 ; 59.19,22.35 60.51,22.35 ; 59.19,22.35 58.15,22.35 ; 58.15,22.35 56.64,22.35 56.39,22.1 R14.2 ; 58.15,22.35 58.17,22.33 C13.1
$1N108: length 10.4
  Top Layer w0.254: R12.2 51.18,25.65 51.78,26.25 60.51,26.25
$1N109: length 9.9
  Top Layer w0.254: 60.51,24.3 54.65,24.3 53.23,22.88 R13.2
$1N112: length 3.5
  Top Layer w0.254: R18.2 68.96,22.1 68.71,22.35 U4.17
$1N121: length 7.7
  Top Layer w0.254: 58.13,30.1 58.1,30.07 58.1,28.97 ; 58.13,30.1 56.77,30.1 56.39,29.72 56.39,28.98 56.41,28.96 ; 58.13,30.1 58.93,30.1 59.31,29.72 59.31,28.45 59.56,28.2 60.51,28.2
$1N122: length 5.8
  Top Layer w0.254: C9.2 64.2,29.4 63.65,28.85 60.51,28.85
$1N123: length 3.8
  Top Layer w0.254: 60.51,29.5 62.39,29.5 62.8,29.91 C9.1
$1N139: length 4.2
  Top Layer w0.254: U7.1 9.7,20.87 7.24,20.87 ; R20.2 7.24,20.87 ; 7.24,20.87 R19.1

## Copper pours and planes (outline as drawn; the poured copper is in the pictures)
3V3 on Top Layer: 9.53,33.87 13.17,33.87 13.18,33.86 13.18,31.57 15.11,31.57 15.11,24.38 15.07,24.34 8.08,24.34 8.08,22.73 6.53,22.73 6.53,25.65 9.02,25.65 9.02,31.24 9.53,31.24
3V3 on Bottom Layer: 9.14,31.11 14.99,31.11 14.99,24.89 9.14,24.89
+24V on Top Layer: 10.61,18.65 13.43,18.65 13.43,22.48 15.26,22.48 15.26,19.17 14.48,19.17 14.48,16.95 12.7,16.95 12.7,12.44 10.53,12.44 10.53,18.57
GND on Top Layer: 0,34.5 81.25,34.5 81.25,0 0,0
GND on Bottom Layer: 0,34.5 81.25,34.5 81.25,0 0,0
VCOM on Top Layer: 9.27,6.58 9.27,4.62 5.03,4.62 2.2,7.45 2.2,14.23 3.87,14.23 3.87,7.95 5.25,6.58
$1N134 on Top Layer: 7.11,7.24 7.11,10.22 12.7,10.22 12.7,4.7 12.58,4.7 12.57,4.69 10.8,4.69 10.8,7.24

Small or netless copper shapes (teardrops, artwork), in the pictures only: 255 on Top Layer, 52 on Bottom Layer

## Text on the board
Top Silkscreen Layer: TX | 3V3 | DIO | RX | NRST | CLK | GND | B- | B+ | A- | A+ | + | - | 一号电机 | 二号电机 | 霍尔传感器 | ！
